# Altium schematic sheet LPF(500Hz).SchDoc
size A; SheetNumber: 6; SheetTotal: 6
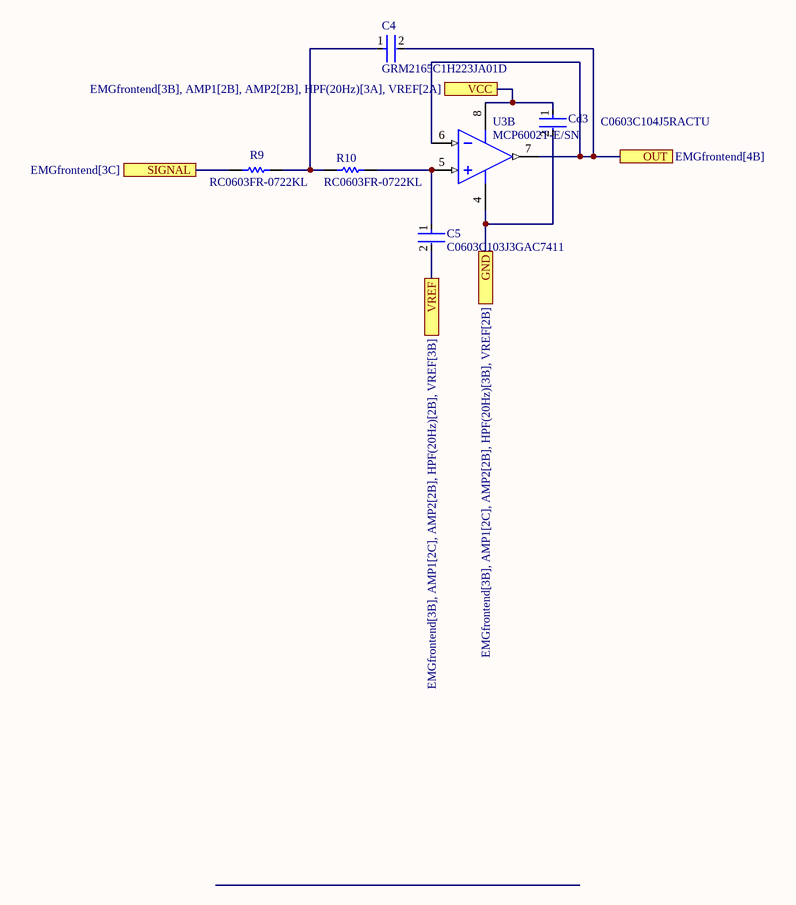
[diagram p0: LPF(500Hz).SchDoc]

## Parts
C4  GRM2165C1H223JA01D  [FP-GRM216-0_1-0_05-D]
C5  C0603C103J3GAC7411  [FP-C0603C-CF-MFG]
Cd3  C0603C104J5RACTU  [FP-C0603C-CF-MFG]
R9  RC0603FR-0722KL  [RESC1608X55X25ML10T15]
R10  RC0603FR-0722KL  [RESC1608X55X25ML10T15]
U3  MCP6002T-E/SN  [SOIC-SN8_N]  (part B of 2)

## Ports
GND (see EMGfrontend[3B], AMP1[2C], AMP2[2B], HPF(20Hz)[3B], VREF[2B]), OUT (see EMGfrontend[4B]), SIGNAL (see EMGfrontend[3C]), VCC (see EMGfrontend[3B], AMP1[2B], AMP2[2B], HPF(20Hz)[3A], VREF[2A]), VREF (see EMGfrontend[3B], AMP1[2C], AMP2[2B], HPF(20Hz)[2B], VREF[3B])

## Nets
GND: Cd3.2 U3.4(VSS) ; port GND
OUT: C4.2 U3.6(VINB-) U3.7(VOUTB) ; port OUT
SIGNAL: R9.1 ; port SIGNAL
VCC: Cd3.1 U3.8(VDD) ; port VCC
VREF: C5.2 ; port VREF
NetC4_1: C4.1 R9.2 R10.1
NetC5_1: C5.1 R10.2 U3.5(VINB+)

## Library data of the parts
C4 = CMP-06035-050815-1: Chip Multilayer Ceramic Capacitors for General Purpose, 0805, 22000pF, C0G, 30ppm/°C, 5%, 50V
C5 = CMP-03020-031050-2: C0603 10,000 pF C0G 30ppm/°C 5.00% 25 V; Manufacturer: KEMET; Tolerance: 0.05; Material: Ceramic; Automotive Grade: Grade 1; Voltage Rating: 25 V; Device Class L3: Ceramic Capacitors; ComponentLink2URL: https://api.kemet.com/component-edge/download/datasheet/C0603C100J5GACAUTO.pdf; Capacitance: 10,000 pF; RoHS: TRUE; Manufacturer Part Number: C0603C103J3GAC7411; Temperature Coefficient: 30ppm/°C; Lead Free: Yes; Height: 0.87mm; Temperature Range Low: -55°C; Value: 10,000 pF; Temperature Range High: +125°C; ComponentLink2Description: Datasheet; Package: C0603C-CF; Temperature Characteristic: C0G; Temperature: -55°C to +125°C; Category: Cap; Octopart: https://octopart.com/c0603c103j3gac7411-kemet-91893810; Device Class L2: Capacitors; Device Class L1: Passive Components; Automotive: Yes
Cd3 = CMP-2006-03056-2: CAP CER 0.1UF 50V 5% X7R 0603; Manufacturer: KEMET; Automotive Grade: Grade 1; Tolerance: 0.05; Capacitance: 0.10 μF; Value: 0.10 μF; Temperature Coefficient: 30ppm/°C; ComponentLink2Description: Datasheet; Voltage Rating: 50 V; Digikey Description: CAP CER 0.1UF 50V 5% X7R 0603; Manufacturer Part Number: C0603C104J5RACTU; Temperature Range High: +125°C; Device Class L2: Capacitors; Octopart: https://octopart.com/c0603c104j5ractu-kemet-10440638; RoHS: TRUE; Mouser Description: Multilayer Ceramic Capacitors MLCC - SMD/SMT 50volts 0.1uF X7R 5%; Temperature Range Low: -55°C; Automotive: Yes; Lead Free: Yes; ComponentLink2URL: https://api.kemet.com/component-edge/download/datasheet/C0603C100J5GACAUTO.pdf; Material: Ceramic; Device Class L3: Ceramic Capacitors; Package: C0603C-CF; Category: Cap; Temperature: -55°C to +125°C; Height: 0.87mm; Temperature Characteristic: X7R; Device Class L1: Passive Components
R9 R10 = CMP-1012-00659-3: Chip Resistor, 22 KOhm, +/- 1%, 0.1 W, -55 to 155 degC, 0603 (1608 Metric), RoHS, Tape and Reel; Tolerance: 10%; Current Rating: 290 mA; Shielding: Unshielded; Resistance: 2.9 Ohm; PackageReference: 0603; PackageDescription: 2-Pin Surface Mount Device, Body 1.6 x 0.8 mm; ComponentLink2URL: http://www.yageo.com/documents/recent/PYu-RC_Group_51_RoHS_L_04.pdf; RoHSCompliant: True; REACH SVHC: No SVHC; ComponentLink1Description: Manufacturer URL; ComponentLink2Description: Datasheet; DatasheetVersion: Rev. 4, 02/2016; Min Operating Temperature: -55degC; Pins: 2; Mount: Through Hole; Height: 11 mm; Packaging: Bulk; Radiation Hardening: No; Package Quantity: 100; Diameter: 8.5 mm; Lead Pitch: 5 mm; Case/Package: Radial; Max Operating Temperature: 105degC; ComponentLink1URL: http://www.yageo.com/
U3 = CMP-0187-00363-3: None; Nominal Supply Current: 100uA; Operating Supply Voltage: 5.5V; Input Bias Current: 1pA; Output Current per Channel: 23mA; Unity Gain Bandwidth Product: 1MHz; Number of Elements: 2; Power Supply Rejection Ratio (PSRR): 86dB; Slew Rate: 0.6V/µs; Min Supply Voltage: 1.8V; Voltage Gain: 112dB; Max Supply Voltage: 6V; Input Offset Voltage (Vos): 4.5mV; Common Mode Rejection Ratio: 60dB; Amplifier Type: GENERAL PURPOSE; Technology: CMOS; Output Current: 23mA; Number of Pins: 8; Lead Free: Lead Free; Number of Channels: 2; Package Quantity: 3300; Max Operating Temperature: 125°C; Number of Circuits: 2; Supply Current: 100uA; Gain Bandwidth Product: 1MHz; Min Operating Temperature: -40°C; Series: -; Mount: Surface Mount; Case/Package: SOIC; Radiation Hardening: No; Packaging: Tape and Reel; Operating Supply Current: 100uA; RoHS Compliant: Yes